# Altium project 07_PCB_Project_07.PrjPcb
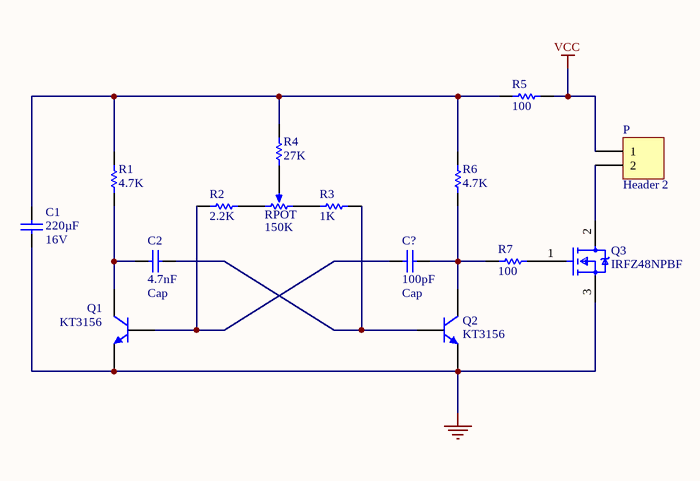
[diagram p0: Sheet1.SchDoc]
1 sheet, 15 parts. Net scope: global (net labels, ports and power ports of the same name join across sheets).
Board file: PCB1.pcbdoc

## Sheet Sheet1.SchDoc
size A; SheetNumber: 1; SheetTotal: 1; SPICEModelCacheNNVTFLWR: <root> / <DocumentId>NNVTFLWR</DocumentId> / <CacheFrame Number="0"> / <Model Name="npn" Kind="MDL"> / <Text>*Default NPN BJT / *NPN Trans Pinout: C,B,E / .MODEL NPN NPN()</Text> / </Model> / </CacheFrame> / </root>

### Parts
C1  16V  value 220µF  [RAD-0.3]
C2  Cap  value 4.7nF  [RAD-0.3]
C?  Cap  value 100pF  [RAD-0.3]
P  Header 2  [HDR1X2]
Q1  KT3156  [TO-226-AA]
Q2  KT3156  [TO-226-AA]
Q3  IRFZ48NPBF  [FP-PG-TO220-3-MFG]
R1  value 4.7K  [AXIAL-0.3]  (hidden comment: Res1)
R2  value 2.2K  [AXIAL-0.3]  (hidden comment: Res1)
R3  value 1K  [AXIAL-0.3]  (hidden comment: Res1)
R4  value 27K  [AXIAL-0.3]  (hidden comment: Res1)
R5  value 100  [AXIAL-0.3]  (hidden comment: Res1)
R6  value 4.7K  [AXIAL-0.3]  (hidden comment: Res1)
R7  value 100  [AXIAL-0.3]  (hidden comment: Res1)
RPOT  value 150K  [VR5]  (hidden comment: RPot)

### Nets
GND: C1.1 Q1.3(E) Q2.3(E) Q3.3(S)
VCC: P.1 R5.1
NetC1_2: C1.2 R1.2 R4.2 R5.2 R6.2
NetC2_1: C2.1 Q2.2(B) R3.1
NetC2_2: C2.2 Q1.1(C) R1.1
NetC?_1: C?.1 Q1.2(B) R2.2
NetC?_2: C?.2 Q2.1(C) R6.1 R7.2
NetP_2: P.2 Q3.2(D)
NetQ3_1: Q3.1(G) R7.1
NetR2_1: R2.1 RPOT.2(BOT)
NetR3_2: R3.2 RPOT.1(TOP)
NetR4_1: R4.1 RPOT.3(TAP)

### Library data of the parts
C1 C2 C? = Cap: Capacitor; Published: 8-Jun-2000; LatestRevisionDate: 17-Jul-2002; LatestRevisionNote: Re-released for DXP Platform.; PackageReference: RAD-0.3; Publisher: Altium Limited; PackageDescription: Radial Cap, Thru-Hole; 2 Leads; 0.3 in Pin Spacing
P = Header 2: Header, 2-Pin; LatestRevisionDate: 17-Jul-2002; LatestRevisionNote: Re-released for DXP Platform.; Publisher: Altium Limited
Q1 Q2 = NPN: NPN Bipolar Transistor; Published: 8-Jun-2000; LatestRevisionDate: 17-Jul-2002; LatestRevisionNote: Re-released for DXP Platform.; PackageReference: TO-226-AA; Publisher: Altium Limited; PackageDescription: TO, Flat Index; 3 In-Line, Axial Leads; Body Dia. 4.8mm; Leads 0.55 x 0.51 mm (max); Code_JEDEC: TO-226-AA
Q3 = CMP-32901-000393-1: MOSFET N-CH 55V 64A TO220AB; Threshold Voltage: 4V; Max Power Dissipation: 130W; Turn-On Delay Time: 12ns; Gate to Source Voltage (Vgs): 20V; Input Capacitance: 1.97nF; Rds On Max: 14mR; Element Configuration: Single; Rise Time: 78ns; Turn-Off Delay Time: 34ns; Halogen Free: Halogen Free; Drain to Source Breakdown Voltage: 55V; Continuous Drain Current (ID): 64A; Lead Free: Lead Free; Mount: Through Hole; Height: 0.65inch; Min Operating Temperature: -55°C; RoHS Compliant: Yes; Drain to Source Voltage (Vdss): 55V; Packaging: Rail/Tube; Length: 0.42inch; Max Operating Temperature: 175°C; Number of Pins: 3; Width: 0.19inch; Power Dissipation: 130W; Contact Plating: Tin; Case/Package: TO-220; REACH SVHC: No SVHC; Max Dual Supply Voltage: 55V; Drain to Source Resistance: 14mR
R1-R7 = Res1: Resistor; Published: 8-Jun-2000; LatestRevisionDate: 17-Jul-2002; LatestRevisionNote: Re-released for DXP Platform.; PackageReference: AXIAL-0.3; Publisher: Altium Limited; PackageDescription: Axial Device, Thru-Hole; 2 Leads; 0.3 in Pin Spacing
RPOT = RPot: Potentiometer; Sim Note: Enter the Resistance value and the set point into parameter fields.; Set Position: 0.5; Published: 8-Jun-2000; LatestRevisionDate: 17-Jul-2002; LatestRevisionNote: Re-released for DXP Platform.; PackageReference: VR5; Publisher: Altium Limited; PackageDescription: Variable Resistor, Thru-Hole; 3 Leads